# Altium schematic sheet Connector_Card1.SchDoc
size A4; SheetNumber: 3; SheetTotal: 4
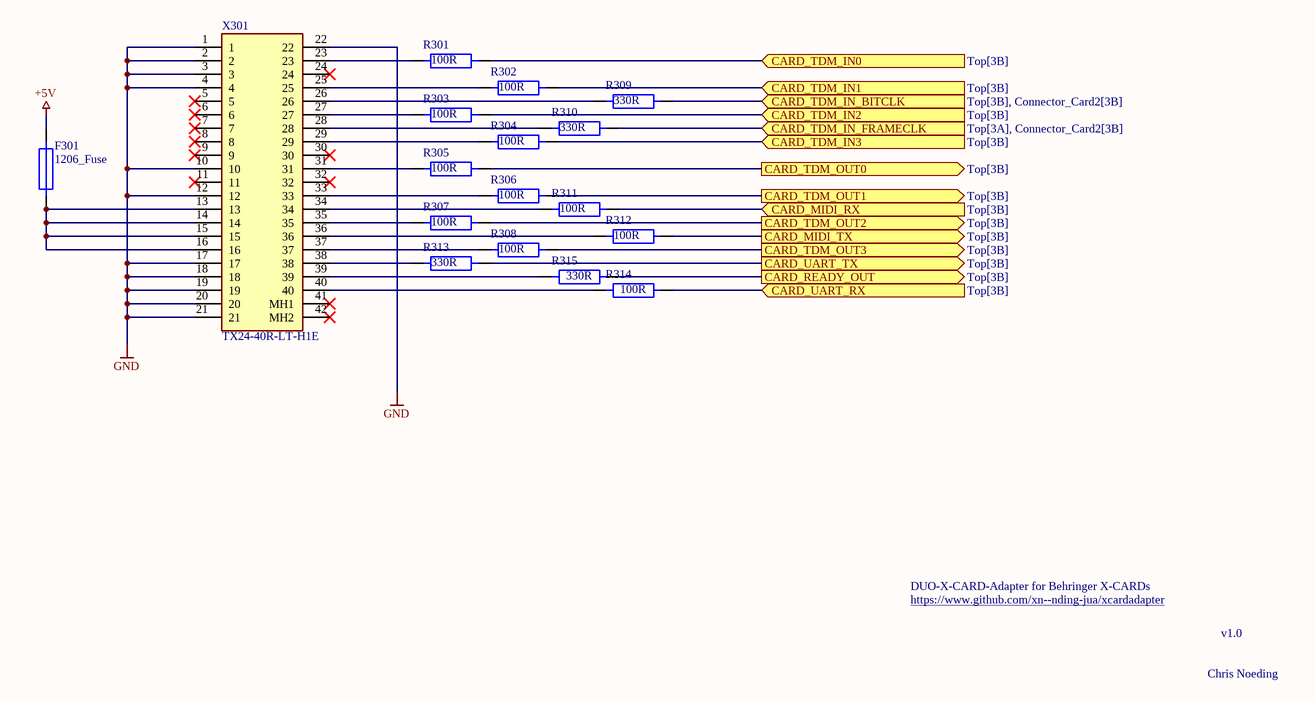
[diagram p0: Connector_Card1.SchDoc]

## Parts
F301  1206_Fuse  [1206]
R301  100R  [1206]
R302  100R  [1206]
R303  100R  [1206]
R304  100R  [1206]
R305  100R  [1206]
R306  100R  [1206]
R307  100R  [1206]
R308  100R  [1206]
R309  330R  [1206]
R310  330R  [1206]
R311  100R  [1206]
R312  100R  [1206]
R313  330R  [1206]
R314  100R  [1206]
R315  330R  [1206]
X301  TX24-40R-LT-H1E  [TX2440RLTH1E]

## Ports
CARD_MIDI_RX (in, see Top[3B]), CARD_MIDI_TX (out, see Top[3B]), CARD_READY_OUT (out, see Top[3B]), CARD_TDM_IN0 (in, see Top[3B]), CARD_TDM_IN1 (in, see Top[3B]), CARD_TDM_IN2 (in, see Top[3B]), CARD_TDM_IN3 (in, see Top[3B]), CARD_TDM_IN_BITCLK (in, see Top[3B], Connector_Card2[3B]), CARD_TDM_IN_FRAMECLK (in, see Top[3A], Connector_Card2[3B]), CARD_TDM_OUT0 (out, see Top[3B]), CARD_TDM_OUT1 (out, see Top[3B]), CARD_TDM_OUT2 (out, see Top[3B]), CARD_TDM_OUT3 (out, see Top[3B]), CARD_UART_RX (in, see Top[3B]), CARD_UART_TX (out, see Top[3B])

## Nets
+5V: F301.2
GND: X301.1 X301.2 X301.3 X301.4 X301.10 X301.12 X301.17 X301.18 X301.19 X301.20 X301.21 X301.22
CARD_MIDI_RX: R311.2 ; port CARD_MIDI_RX
CARD_MIDI_TX: R312.2 ; port CARD_MIDI_TX
CARD_READY_OUT: R315.2 ; port CARD_READY_OUT
CARD_TDM_IN0: R301.2 ; port CARD_TDM_IN0
CARD_TDM_IN1: R302.2 ; port CARD_TDM_IN1
CARD_TDM_IN2: R303.2 ; port CARD_TDM_IN2
CARD_TDM_IN3: R304.2 ; port CARD_TDM_IN3
CARD_TDM_IN_BITCLK: R309.2 ; port CARD_TDM_IN_BITCLK
CARD_TDM_IN_FRAMECLK: R310.2 ; port CARD_TDM_IN_FRAMECLK
CARD_TDM_OUT0: R305.2 ; port CARD_TDM_OUT0
CARD_TDM_OUT1: R306.2 ; port CARD_TDM_OUT1
CARD_TDM_OUT2: R307.2 ; port CARD_TDM_OUT2
CARD_TDM_OUT3: R308.2 ; port CARD_TDM_OUT3
CARD_UART_RX: R314.2 ; port CARD_UART_RX
CARD_UART_TX: R313.2 ; port CARD_UART_TX
NetF301_1: F301.1 X301.13 X301.14 X301.15 X301.16
NetR301_1: R301.1 X301.23
NetR302_1: R302.1 X301.25
NetR303_1: R303.1 X301.27
NetR304_1: R304.1 X301.29
NetR305_1: R305.1 X301.31
NetR306_1: R306.1 X301.33
NetR307_1: R307.1 X301.35
NetR308_1: R308.1 X301.37
NetR309_1: R309.1 X301.26
NetR310_1: R310.1 X301.28
NetR311_1: R311.1 X301.34
NetR312_1: R312.1 X301.36
NetR313_1: R313.1 X301.38
NetR314_1: R314.1 X301.40
NetR315_1: R315.1 X301.39

Not connected (* = marked no-connect by the designer): X301 5* 6* 7* 8* 9* 11* 24* 30* 32* 41(MH1)* 42(MH2)*

## Notes on the sheet
- DUO-X-CARD-Adapter for Behringer X-CARDs
- https://www.github.com/xn--nding-jua/xcardadapter
- v1.0
- Chris Noeding

## Library data of the parts
R301-R304 R307-R315 = 1206_R: SMA-ArtikelNr: *
R305 R306 = 1206_R: 330R; SMA-ArtikelNr: *
X301 = TX24-40R-LT-H1E: Connector; Manufacturer_Name: JAE; Datasheet Link: https://www.jae.com/direct/topics/topics_file_download/topics_id=66739&ext_no=06&index=0&_lang=en&v=; Height: 9.2mm; Manufacturer_Part_Number: TX24-40R-LT-H1E; Mouser Part Number: 656-TX24-40R-LT-H1E; Mouser Price/Stock: https://www.mouser.co.uk/ProductDetail/JAE-Electronics/TX24-40R-LT-H1E?qs=qo47cMy2QCeuMLTrRKCbyg%3D%3D
F301 = 1206_Fuse: SMA-ArtikelNr: *